# Altium schematic sheet P1.schdoc
size 297 x 209 mm; Symbol: Drawing-Symbol_A4; Device: Drawing-Symbol_A4; Company: 嘉立创EDA; Version: V1.0; Page Size: A4; @Project Name: IC卡门禁-课设; @Update Date: 2026-09-24; @Create Date: 2026-09-24; @Board Name: Board1; @Page Name: P1; @Create Time: 17:26:28; @Page Count: 1; @Page No: 1; @Schematic Name: Schematic1; @Update Time: 17:26:28; @Assembly Variant: Basic; Border: 1; Title Block Position: 3; Size: A4; Width: 1170; Height: 825; Region Start: 1; X Region Count: 6; Y Region Count: 4; Blade Width: 10
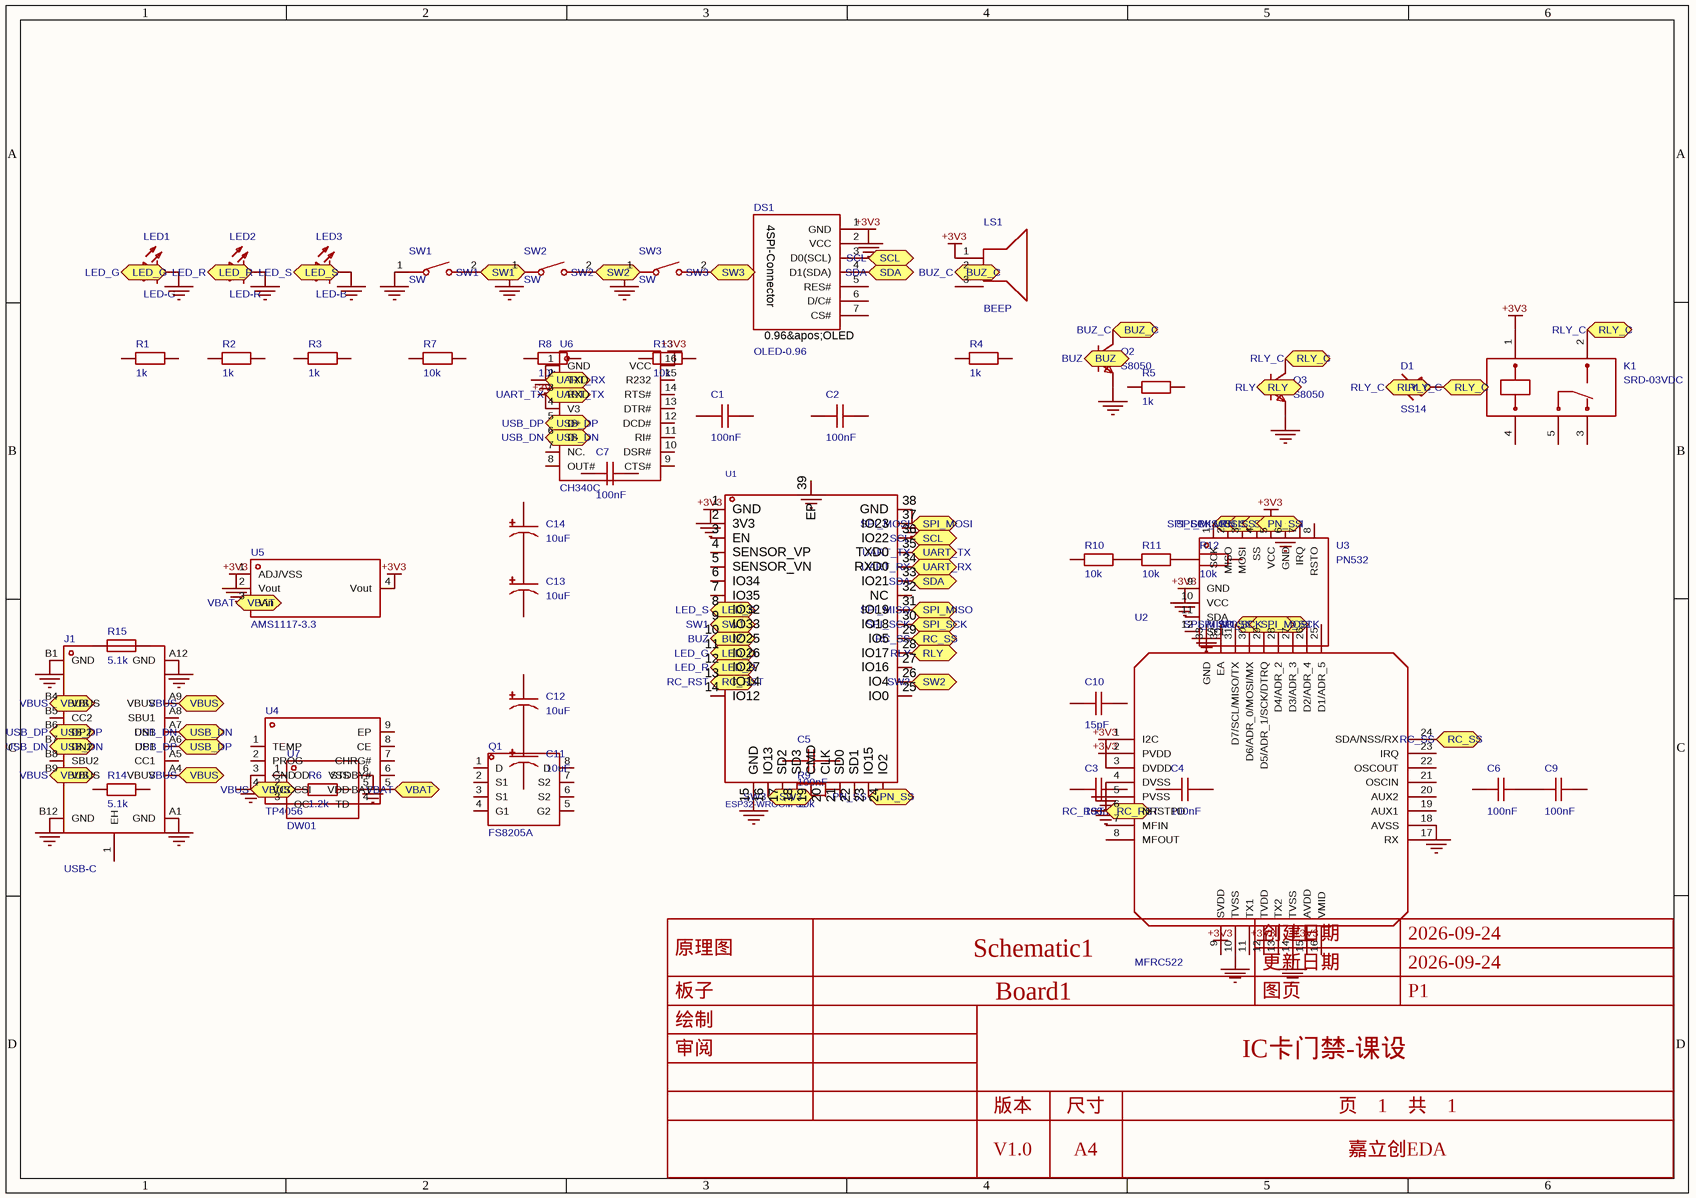
[diagram p0: P1.schdoc]

## Parts
C1  100nF  [C0603]
C2  100nF  [C0603]
C3  100nF  [C0603]
C4  100nF  [C0603]
C5  100nF  [C0603]
C6  100nF  [C0603]
C7  100nF  [C0603]
C9  100nF  [C0603]
C10  15pF  [C0603]
C11  10uF  [CAP-SMD_BD4.0-L4.3-W4.3-LS5.3-FD]
C12  10uF  [CAP-SMD_BD4.0-L4.3-W4.3-LS5.3-FD]
C13  10uF  [CAP-SMD_BD4.0-L4.3-W4.3-LS5.3-FD]
C14  10uF  [CAP-SMD_BD4.0-L4.3-W4.3-LS5.3-FD]
D1  SS14  [SOD-323_L1.7-W1.3-LS2.6-RD-1]
DS1  OLED-0.96  [OLED-TH_JX040101-1]
J1  USB-C  [TYPE-C-SMD_16P-UCB11L69P16]
K1  SRD-03VDC  [RELAY-TH_SRD-XXVDC-XL-C]
LED1  LED-G  [LED-TH_BD4.0-P2.54-FD_RED]
LED2  LED-R  [LED-TH_BD4.0-P2.54-FD_RED]
LED3  LED-B  [LED-TH_BD4.0-P2.54-FD_RED]
LS1  BEEP  [BUZ-SMD_3P-L5.2-W5.2-P3.50-BR]
Q1  FS8205A  [TSSOP-8_L4.4-W3.0-P0.65-LS6.4-BL-2]
Q2  S8050  [SOT-23-3_L2.9-W1.3-P1.90-LS2.4-BR]
Q3  S8050  [SOT-23-3_L2.9-W1.3-P1.90-LS2.4-BR]
R1  1k  [R0603]
R2  1k  [R0603]
R3  1k  [R0603]
R4  1k  [R0603]
R5  1k  [R0603]
R6  1.2k  [R0603]
R7  10k  [R0603]
R8  10k  [R0603]
R9  10k  [R0603]
R10  10k  [R0603]
R11  10k  [R0603]
R12  10k  [R0603]
R13  10k  [R0603]
R14  5.1k  [R0603]
R15  5.1k  [R0603]
SW1  SW  [SW-SMD_L4.0-W2.9-LS5.0]
SW2  SW  [SW-SMD_L4.0-W2.9-LS5.0]
SW3  SW  [SW-SMD_L4.0-W2.9-LS5.0]
U1  ESP32-WROOM-32  [WIFIM-SMD_ESP-WROOM-32]
U2  MFRC522  [QFN-32_L5.0-W5.0-P0.50-BL-EP3.4]
U3  PN532  [COMM-TH_L42.7-W40.4_PN532_NFC_RFID]
U4  TP4056  [SOP-8_L4.9-W3.9-P1.27-LS6.0-TL-EP]
U5  AMS1117-3.3  [SOT-223-3_L6.5-W3.4-P2.30-LS7.0-BR]
U6  CH340C  [SOP-16_L10.0-W3.9-P1.27-LS6.0-BL]
U7  DW01  [SOT-23-6_L2.9-W1.6-P0.95-LS2.8-BL]

## Ports
BUZ (bidir), BUZ_C (bidir), LED_G (bidir), LED_R (bidir), LED_S (bidir), PN_SS (bidir), RC_RST (bidir), RC_SS (bidir), RLY (bidir), RLY_C (bidir), SCL (bidir), SDA (bidir), SPI_MISO (bidir), SPI_MOSI (bidir), SPI_SCK (bidir), SW1 (bidir), SW2 (bidir), SW3 (bidir), UART_RX (bidir), UART_TX (bidir), USB_DN (bidir), USB_DP (bidir), VBAT (bidir), VBUS (bidir)

## Nets
+3V3: DS1.2(VCC) K1.1 LS1.1(+) U1.2(3V3) U2.2(PVDD) U2.3(DVDD) U2.9(SVDD) U2.12(TVDD) U2.15(AVDD) U3.5(VCC) U3.10(VCC) U5.2(Vout) U5.4(Vout) U6.4(V3) U6.16(VCC)
GND: DS1.1(GND) J1.A1(GND) J1.A12(GND) J1.B1(GND) J1.B12(GND) LED1.2(-) LED2.2(-) LED3.2(-) Q2.2(E) Q3.2(E) SW1.1 SW2.1 SW3.1 U1.1(GND) U1.15(GND) U1.38(GND) U1.39(EP) U2.4(DVSS) U2.5(PVSS) U2.10(TVSS) U2.14(TVSS) U2.18(AVSS) U2.33(GND) U3.6(GND) U3.9(GND) U4.3(GND) U5.1(ADJ/VSS) U6.1(GND) U7.6(VSS)
BUZ: Q2.1(B) U1.10(IO25) ; port BUZ
BUZ_C: LS1.2(-) Q2.3(C) ; port BUZ_C
LED_G: LED1.1(+) U1.11(IO26) ; port LED_G
LED_R: LED2.1(+) U1.12(IO27) ; port LED_R
LED_S: LED3.1(+) U1.8(IO32) ; port LED_S
PN_SS: U1.23(IO15) U3.4(SS) ; port PN_SS
RC_RST: U1.13(IO14) U2.6(NRSTPD) ; port RC_RST
RC_SS: U1.29(IO5) U2.24(SDA/NSS/RX) ; port RC_SS
RLY: Q3.1(B) U1.28(IO17) ; port RLY
RLY_C: D1.1 D1.2 K1.2 Q3.3(C) ; port RLY_C
SCL: DS1.3(D0(SCL)) U1.36(IO22) ; port SCL
SDA: DS1.4(D1(SDA)) U1.33(IO21) ; port SDA
SPI_MISO: U1.31(IO19) U2.31(D7/SCL/MISO/TX) U3.2(MISO) ; port SPI_MISO
SPI_MOSI: U1.37(IO23) U2.30(D6/ADR_0/MOSI/MX) U3.3(MOSI) ; port SPI_MOSI
SPI_SCK: U1.30(IO18) U2.29(D5/ADR_1/SCK/DTRQ) U3.1(SCK) ; port SPI_SCK
SW1: SW1.2 U1.9(IO33) ; port SW1
SW2: SW2.2 U1.26(IO4) ; port SW2
SW3: SW3.2 U1.16(IO13) ; port SW3
UART_RX: U1.34(RXD0) U6.2(TXD) ; port UART_RX
UART_TX: U1.35(TXD0) U6.3(RXD) ; port UART_TX
USB_DN: J1.A7(DN1) J1.B7(DN2) U6.6(D-) ; port USB_DN
USB_DP: J1.A6(DP1) J1.B6(DP2) U6.5(D+) ; port USB_DP
VBAT: U4.5(BAT) U5.3(Vin) ; port VBAT
VBUS: J1.A4(VBUS) J1.A9(VBUS) J1.B4(VBUS) J1.B9(VBUS) U4.4(VCC) ; port VBUS
NetC6_2: C6.2 C9.1
NetC11_1: C11.1 C12.2
NetC13_1: C13.1 C14.2
NetR10_2: R10.2 R11.1
NetR11_2: R11.2 R12.1

Not connected (* = marked no-connect by the designer): C1 1 2; C2 1 2; C3 1 2; C4 1 2; C5 1 2; C6 1; C7 1 2; C9 2; C10 1 2; C11 2; C12 1; C13 2; C14 1; DS1 5(RES#) 6(D/C#) 7(CS#); J1 1(EH) A5(CC1) A8(SBU1) B5(CC2) B8(SBU2); K1 3 4 5; LS1 3(NC); Q1 1(D) 2(S1) 3(S1) 4(G1) 5(G2) 6(S2) 7(S2) 8(D); R1 1 2; R2 1 2; R3 1 2; R4 1 2; R5 1 2; R6 1 2; R7 1 2; R8 1 2; R9 1 2; R10 1; R12 2; R13 1 2; R14 1 2; R15 1 2; U1 3(EN) 4(SENSOR_VP) 5(SENSOR_VN) 6(IO34) 7(IO35) 14(IO12) 17(SD2) 18(SD3) 19(CMD) 20(CLK) 21(SD0) 22(SD1) 24(IO2) 25(IO0) 27(IO16) 32(NC); U2 1(I2C) 7(MFIN) 8(MFOUT) 11(TX1) 13(TX2) 16(VMID) 17(RX) 19(AUX1) 20(AUX2) 21(OSCIN) 22(OSCOUT) 23(IRQ) 25(D1/ADR_5) 26(D2/ADR_4) 27(D3/ADR_3) 28(D4/ADR_2) 32(EA); U3 7(IRQ) 8(RSTO) 11(SDA) 12(SCL); U4 1(TEMP) 2(PROG) 6(STDBY#) 7(CHRG#) 8(CE) 9(EP); U6 7(NC.) 8(OUT#) 9(CTS#) 10(DSR#) 11(RI#) 12(DCD#) 13(DTR#) 14(RTS#) 15(R232); U7 1(OD) 2(CSI) 3(OC) 4(TD) 5(VDD)

## Notes on the sheet
- 创建日期
- 2026-09-24
- 原理图
- 板子
- Schematic1
- Board1
- 更新日期
- 图页
- P1
- 绘制
- 审阅
- IC卡门禁-课设
- 版本
- V1.0
- 尺寸
- A4
- 页    1    共    1
- 嘉立创EDA
- (in symbol JX040102-1) 4SPI-Connector; 0.96&apos;OLED

## Library data of the parts
C1-C7 C9 = ST18B104K500CT: 容值:100nF;精度:±10%;额定电压:50V;温度系数:X7R;; Manufacturer: Walsin(华新科); Add into BOM: yes; PCB Layer: Default; Tolerance: ±10%; Voltage Rating: 50V; Temperature Coefficient: X7R; ModelId: ac125912035d415993ca9572d50418b10819f05c4eef4c71ace90d822a990e87; ModelName: C0603_L1.6-W0.8-H0.8; ModelTransform: 62.992,31.496,0,0,0,0,0,0,0; Symbol: ST18B104K500CT; Device: ST18B104K500CT; Convert to PCB: yes; Manufacturer Part: ST18B104K500CT; Supplier: LCSC; Supplier Part: C2918557; LCSC Part Name: 100nF ±10% 50V; Supplier Footprint: 0603; JLCPCB Part Class: Extended Part; Datasheet: https://item.szlcsc.com/datasheet/ST18B104K500CT/3220409.html; Value: 100nF; FootprintName: C0603
C10 = ST18B104K500CT: 容值:100nF;精度:±10%;额定电压:50V;温度系数:X7R;; Manufacturer: Walsin(华新科); Add into BOM: yes; PCB Layer: Default; Value: 100nF; Tolerance: ±10%; Voltage Rating: 50V; Temperature Coefficient: X7R; ModelId: ac125912035d415993ca9572d50418b10819f05c4eef4c71ace90d822a990e87; ModelName: C0603_L1.6-W0.8-H0.8; ModelTransform: 62.992,31.496,0,0,0,0,0,0,0; Symbol: ST18B104K500CT; Device: ST18B104K500CT; Convert to PCB: yes; Manufacturer Part: ST18B104K500CT; Supplier: LCSC; Supplier Part: C2918557; LCSC Part Name: 100nF ±10% 50V; Supplier Footprint: 0603; JLCPCB Part Class: Extended Part; Datasheet: https://item.szlcsc.com/datasheet/ST18B104K500CT/3220409.html; FootprintName: C0603
C11-C14 = CAP-SMD 4*5 10uF ±10% 16V: Add into BOM: yes; PCB Layer: Default; ModelId: 43379036ddca4979995a67be678af8900819f05c4eef4c71ace90d822a990e87; ModelTransform: 208.661,169.291,0,0,0,0,0,0,0; Symbol: CAP-SMD 4*5 10UF ±10% 16V; Device: CAP-SMD 4*5 10uF ±10% 16V; Convert to PCB: yes; Manufacturer Part: CAP-SMD 4*5 10uF ±10% 16V; Supplier: LCSC; Supplier Part: C9900020910; LCSC Part Name: CAP-SMD 4*5 10uF ±10% 16V; Supplier Footprint: CAP-SMD 4*5 10uF ±10% 16V; JLCPCB Part Class: Extended Part; FootprintName: CAP-SMD_BD4.0-L4.3-W4.3-LS5.3-FD; ModelName: CAP-SMD_BD4.0-L4.3-W4.3-LS5.3-FD
D1 = SS14_C9900013398: Add into BOM: yes; PCB Layer: Default; ModelId: eba151483b2844ffacda3a6d97308fa10819f05c4eef4c71ace90d822a990e87; ModelTransform: 100.394,49.2125,0,0,0,0,0,0,0; Symbol: SS14_C9900013398; Device: SS14_C9900013398; Convert to PCB: yes; Manufacturer Part: SS14; Supplier: LCSC; Supplier Part: C9900013398; LCSC Part Name: SS14; Supplier Footprint: SS14/SOD323; JLCPCB Part Class: Extended Part; FootprintName: SOD-323_L1.7-W1.3-LS2.6-RD-1; ModelName: SOD-323_L1.7-W1.3-LS2.6-RD-1
DS1 = JX040102-1: Manufacturer: 技小新; Add into BOM: yes; PCB Layer: Default; ModelId: 8e61ee9dba7b44a2b1026f33715d9dad0819f05c4eef4c71ace90d822a990e87; ModelTransform: 1181.1,1141.73,0,0,0,0,0,-511.102,0; Symbol: JX040102-1; Device: JX040102-1; Convert to PCB: yes; Manufacturer Part: JX040102-1; Supplier: LCSC; Supplier Part: C284855; LCSC Part Name: OLED显示器模块-0.96寸(4PIN)(白色); Supplier Footprint: SMD,30x29mm; JLCPCB Part Class: Extended Part; Datasheet: https://item.szlcsc.com/datasheet/JX040102-1/270264.html; FootprintName: OLED-TH_JX040101-1; ModelName: OLED-TH_JX040101-1
J1 = UCB11L69P16: Add into BOM: yes; PCB Layer: Default; Symbol: UCB11L69P16; Device: UCB11L69P16; Convert to PCB: yes; Manufacturer Part: UCB11L69P16; Supplier: LCSC; Supplier Part: C9900009190; LCSC Part Name: UCB11L69P16; Supplier Footprint: USBCT8; JLCPCB Part Class: Extended Part; FootprintName: TYPE-C-SMD_16P-UCB11L69P16
K1 = SRD-03VDC-SL-C: 线圈电压:3V;触点形式:一组转换:1C(单刀双掷-转换);触点容量(电阻负载):-;最大切换电压:250V@AC;最大切换电流:15A;; Manufacturer: 松乐; Add into BOM: yes; PCB Layer: Default; Coil Voltage: 3V; Coil Rated Power: 360mW; Switching Current(Max): 15A; Coil Type: 无极性-单线圈; Contact Resistance: 100mΩ; Operate Time: 10ms; ModelId: d0eda9b8bf8746d18ae810ab88dc78e70819f05c4eef4c71ace90d822a990e87; ModelName: RELAY-TH_L19.2-W15.6-H15.8; ModelTransform: 755.904,622.4397,0,0,0,0,34.882,0,-118.11; Symbol: SRD-03VDC-SL-C; Device: SRD-03VDC-SL-C; Convert to PCB: yes; Manufacturer Part: SRD-03VDC-SL-C; Supplier: LCSC; Supplier Part: C24585; LCSC Part Name: 蓝色 单组转换型继电器; Supplier Footprint: 插件,19.2x15.6mm; JLCPCB Part Class: Extended Part; Datasheet: https://item.szlcsc.com/datasheet/SRD-03VDC-SL-C/25325.html; Contact Form: 一组转换:1C(单刀双掷-转换); Number of Pins: 5; Contact Rating: -; Switching Voltage(Max): 250V@AC; Release Time: 10ms; Length: 19.2mm; Width: 15.6mm; Height: 15.8mm; FootprintName: RELAY-TH_SRD-XXVDC-XL-C
LED1-LED3 = LED: Symbol: LED_C9900015665; Add into BOM: yes; PCB Layer: Default; ModelId: 08d245f9ade94e79a608b24242b3e8900819f05c4eef4c71ace90d822a990e87; ModelTransform: 137.561,157.46465,0,0,0,0,-8.858,0,-196.85; Device: LED; Convert to PCB: yes; Manufacturer Part: LED; Supplier: LCSC; Supplier Part: C9900015665; LCSC Part Name: LED; Supplier Footprint: SIP-2P; JLCPCB Part Class: Extended Part; FootprintName: LED-TH_BD4.0-P2.54-FD_RED; ModelName: LED-TH_BD4.0-P2.54-FD_RED
LS1 = BEEP_SMT: Add into BOM: yes; PCB Layer: Default; ModelId: 0044e78390e14de39818311c3b0a88040819f05c4eef4c71ace90d822a990e87; ModelName: BUZ-SMD_3P-L5.2-W5.2-H2.0-P3.50; ModelTransform: 207.31557,204.724,0,180,0,0,0.465,-0.002,0; Symbol: BEEP_SMT; Device: BEEP_SMT; Convert to PCB: yes; Manufacturer Part: BEEP_SMT; Supplier: LCSC; Supplier Part: C9900006792; LCSC Part Name: BEEP_SMT; Supplier Footprint: 无源蜂鸣器; JLCPCB Part Class: Extended Part; FootprintName: BUZ-SMD_3P-L5.2-W5.2-P3.50-BR
Q1 = FS8205A_C14212: 类型:2个N沟道;漏源电压(Vdss):20V;连续漏极电流(Id):6A;功率(Pd):1.5W;导通电阻(RDS(on)@Vgs,Id):38mΩ@2.5V,5.2A;阈值电压(Vgs(th)@Id):1.5V@250uA;; Add into BOM: yes; PCB Layer: Default; Type: 2个N沟道; Drain Source Voltage (Vdss): 20V; Continuous Drain Current (Id): 6A; Power Dissipation (Pd): 1.5W; ModelId: 2d0fd2703afb4f81a9dfc54e2181a6240819f05c4eef4c71ace90d822a990e87; ModelTransform: 118.11,251.968,0,0,0,0,0,0,0; Symbol: 8205A_C14212; Device: FS8205A_C14212; Convert to PCB: yes; Manufacturer Part: FS8205A; Supplier: LCSC; Supplier Part: C14212; LCSC Part Name: 2个N沟道 耐压:20V 电流:6A; Supplier Footprint: TSSOP-8; JLCPCB Part Class: Extended Part; Drain Source On Resistance (RDS(on)@Vgs,Id): 38mΩ@2.5V,5.2A; Gate Threshold Voltage (Vgs(th)@Id): 1.5V@250uA; FootprintName: TSSOP-8_L4.4-W3.0-P0.65-LS6.4-BL-2; ModelName: TSSOP-8_L4.4-W3.0-P0.65-LS6.4-BL-2
Q2 Q3 = S8050: 晶体管类型:NPN;集电极电流(Ic):500mA;集射极击穿电压(Vceo):25V;耗散功率(Pd):300mW;直流电流增益(hFE):400;; Manufacturer: Doeshare(德芯); Symbol: S8050_C2931719; Add into BOM: yes; PCB Layer: Default; type: NPN; Current - Collector(Ic): 500mA; Collector - Emitter Voltage VCEO: 25V; Pd - Power Dissipation: 300mW; DC Current Gain: 400; Transition frequency(fT): 150MHz; Current - Collector Cutoff: 100nA; Vce Saturation(VCE(sat)): 600mV; Emitter-Base Voltage(Vebo): 5V; Number: 1个NPN; ModelId: c62791f0466c4ae2a892c056b845b0ca0819f05c4eef4c71ace90d822a990e87; ModelName: SOT-23-3P_L2.9-W1.3-H1.0-LS2.4-P0.95; ModelTransform: 98.425,114.173,0,180,0,0,0.0005,-0.0005,0; Device: S8050; Convert to PCB: yes; Manufacturer Part: S8050; Supplier: LCSC; Supplier Part: C2931719; LCSC Part Name: NPN 电流:500mA 电压:25V; Supplier Footprint: SOT-23; JLCPCB Part Class: Extended Part; Datasheet: https://item.szlcsc.com/datasheet/S8050/3273402.html; FootprintName: SOT-23-3_L2.9-W1.3-P1.90-LS2.4-BR
R1-R6 = Res_0603: Symbol: 电阻; Add into BOM: yes; PCB Layer: Default; Value: 10K; ModelId: fc143cca1e79419f9cd78b61e9279f080819f05c4eef4c71ace90d822a990e87; ModelTransform: 31.8897,63.7794,0,90,0,0,0,0,0; Device: Res_0603; Convert to PCB: yes; Supplier Footprint: 0603; FootprintName: R0603; ModelName: R0603
R7-R13 = Res_0603: Symbol: 电阻; Add into BOM: yes; PCB Layer: Default; ModelId: fc143cca1e79419f9cd78b61e9279f080819f05c4eef4c71ace90d822a990e87; ModelTransform: 31.8897,63.7794,0,90,0,0,0,0,0; Device: Res_0603; Convert to PCB: yes; Supplier Footprint: 0603; Value: 10K; FootprintName: R0603; ModelName: R0603
R14 R15 = RMC06035.1K1%N: 电阻类型:厚膜电阻;阻值:5.1kΩ;精度:±1%;功率:100mW;工作电压:50V;温度系数:±100ppm/℃;; Manufacturer: Tyohm(幸亚电阻); Add into BOM: yes; PCB Layer: Default; Value: 5.1kΩ; Tolerance: ±1%; Power(Watts): 100mW; Voltage-Supply(Max): 50V; ModelId: fc143cca1e79419f9cd78b61e9279f080819f05c4eef4c71ace90d822a990e87; ModelTransform: 31.8897,63.7794,0,90,0,0,0,0,0; Symbol: RMC06035.1K1%N; Device: RMC06035.1K1%N; Convert to PCB: yes; Manufacturer Part: RMC06035.1K1%N; Supplier: LCSC; Supplier Part: C269716; LCSC Part Name: 厚膜电阻 5.1kΩ ±1% 100mW; Supplier Footprint: 0603; JLCPCB Part Class: Extended Part; Datasheet: https://item.szlcsc.com/datasheet/RMC06035.1K1%2525N/259156.html; Type: 厚膜电阻; Temperature Coefficient: ±100ppm/℃; Operating Temperature: -55℃~+155℃; FootprintName: R0603; ModelName: R0603
SW1-SW3 = 轻触按键3*4*H: Add into BOM: yes; PCB Layer: Default; ModelId: 63599cce708d48afbce1b0db003544770819f05c4eef4c71ace90d822a990e87; ModelName: SW-SMD_L4.0-W2.9-H2-LS5.0; ModelTransform: 196.85,114.173,0,0,0,0,0,0,0; Symbol: 轻触按键3*4*H; Device: 轻触按键3*4*H; Convert to PCB: yes; Manufacturer Part: 轻触按键3*4*H; Supplier: LCSC; Supplier Part: C9900017573; LCSC Part Name: 轻触按键3*4*H; Supplier Footprint: 轻触按键3*4*2.5; JLCPCB Part Class: Extended Part; FootprintName: SW-SMD_L4.0-W2.9-LS5.0
U1 = ESP32-WROOM-32: WiFi+双模蓝牙 双核CPU 网口 顶配MCU 低功耗蓝牙 ESP32系列ESP-WROOM-32模组/ESP-32S 4MB; Add into BOM: yes; PCB Layer: Default; ModelId: 5a2678a0bdc04ba384e1e7621568aeee0819f05c4eef4c71ace90d822a990e87; ModelName: WIFIM-SMD_L25.5-W18.0-H3.1; ModelTransform: 709.4474,1004.3287,0,0,0,0,0,145.633,0; Symbol: ESP-WROOM-32; Device: ESP32-WROOM-32; Convert to PCB: yes; Manufacturer Part: ESP32-WROOM-32; Supplier: LCSC; Supplier Part: C95209; LCSC Part Name: 不带固件; Supplier Footprint: -; JLCPCB Part Class: Extended Part; Datasheet: https://item.szlcsc.com/datasheet/ESP32-WROOM-32/96410.html; Features: 集成蓝牙功能；WIFI直连；在线OTA; FootprintName: WIFIM-SMD_ESP-WROOM-32
U2 = MFRC52202HN1,151: 协议:ISO 14443A,MIFARE;接口类型:I2C,SPI,UART;传输速率:106Kbit/s；848Kbit/s；424Kbit/s；212Kbit/s;; Manufacturer: NXP(恩智浦); Add into BOM: yes; PCB Layer: Default; Value: 13.56MHz; Voltage - Supply: 2.5V~3.3V; ModelId: 9cd7b3b2e5534eca85488abae33e32e30819f05c4eef4c71ace90d822a990e87; ModelName: QFN-32_L5.0-W5.0-H0.9-P0.50; ModelTransform: 197.6374,197.6374,0,90,0,0,-0.789,-0.395,0; Symbol: MFRC52202HN1,151; Device: MFRC52202HN1,151; Convert to PCB: yes; Manufacturer Part: MFRC52202HN1,151; Supplier: LCSC; Supplier Part: C11322; LCSC Part Name: 高度集成读写IC 用于13.56MHz非接触通信; Supplier Footprint: QFN-32-EP(5x5); JLCPCB Part Class: Extended Part; Datasheet: https://www.nxp.com/docs/en/data-sheet/MFRC522.pdf?pspll=1; agreement: ISO 14443A,MIFARE; Interface: I2C,SPI,UART; transmission rate: 106Kbit/s；848Kbit/s；424Kbit/s；212Kbit/s; Features: 内置天线驱动；数据校验; FootprintName: QFN-32_L5.0-W5.0-P0.50-BL-EP3.4
U3 = PN532 NFC RFID Module v4: Add into BOM: yes; PCB Layer: Default; Symbol: PN532 NFC RFID MODULE V4; Device: PN532 NFC RFID Module v4; Convert to PCB: yes; Manufacturer Part: PN532 NFC RFID Module v4; Supplier: LCSC; Supplier Part: C9900233104; LCSC Part Name: PN532 NFC RFID Module v4; Supplier Footprint: 插件; FootprintName: COMM-TH_L42.7-W40.4_PN532_NFC_RFID
U4 = TP4056X-42-ESOP8: 工作电压:4V~8V;最大充电电流:1A;电池类型:锂电池;电池节数:1;; Manufacturer: TOPPOWER(南京拓微); Symbol: TP4056X_C2763448; Add into BOM: yes; PCB Layer: Default; The Chip Type: 充电芯片; Voltage - Supply: 4V~8V; Charge Current - Max: 1A; Charging Saturation Voltage: 4.2V; Type of Battery: 锂电池; Number of Cells: 1; Battery Temperature Detection: 支持; 0V Battery Charge: 不支持; Supply Current (Iq): 70uA; ModelId: 4f1f5228684a45afaa7af8cce46001de0819f05c4eef4c71ace90d822a990e87; ModelName: SOP-8_L4.9-W3.9-H1.45-LS6.0-P1.27; ModelTransform: 236.22,189.751,0,0,0,0,-0.051,0.515,0; Device: TP4056X-42-ESOP8; Convert to PCB: yes; Manufacturer Part: TP4056X-42-ESOP8; Supplier: LCSC; Supplier Part: C2763448; LCSC Part Name: 1A线性锂离子电池充电器; Supplier Footprint: SOP-8-EP; JLCPCB Part Class: Extended Part; Datasheet: https://item.szlcsc.com/datasheet/TP4056X-42-ESOP8/2893069.html; End-Off Voltage: -; Operating Temperature: -40℃~+85℃; Balance Current: -; Interface: -; Features: 恒压充电；恒流充电；自动再充电；充电终止；软启动；可编程充电电流；欠压锁定；涓流充电; FootprintName: SOP-8_L4.9-W3.9-P1.27-LS6.0-TL-EP
U5 = AMS1117-3.3V_C5205141: 输出极性:正极;工作电压:15V;输出电压:3.3V;输出电流:1.2A;电源纹波抑制比(PSRR):-;输出类型:固定;; Manufacturer: JSMSEMI(杰盛微); Add into BOM: yes; PCB Layer: Default; Output Configuration: 正极; Voltage - Supply: 15V; Output Voltage: 3.3V; Output Current: 1.2A; Voltage Dropout: 1.5V@(800mA); standby current: 5mA; Output Type: 固定; Number of Outputs: 1; ModelId: 925194bf9823436183a3e0b978a8d0760819f05c4eef4c71ace90d822a990e87; ModelName: SOT-223-4P_L6.5-W3.5-H1.6-LS7.0-P2.30; ModelTransform: 279.89794,255.905,0,180,0,0,-3.9385,-0.0005,0; Symbol: AMS1117-3.3V_C5205141; Device: AMS1117-3.3V_C5205141; Convert to PCB: yes; Manufacturer Part: AMS1117-3.3V; Supplier: LCSC; Supplier Part: C5205141; LCSC Part Name: AMS1117-3.3V 0.8A 15V; Supplier Footprint: SOT-223; JLCPCB Part Class: Extended Part; Datasheet: https://item.szlcsc.com/datasheet/AMS1117-3.3V/5896504.html; Power Supply Rejection Ratio (PSRR): -; Noise: -; Features: 热关断; Operating Temperature: -20℃~+85℃; FootprintName: SOT-223-3_L6.5-W3.4-P2.30-LS7.0-BR
U6 = CH340C: 应用功能:收发器;USB协议版本:USB 2.0;通道数:-;数据速率:2Mbps;; Manufacturer: WCH(南京沁恒); Add into BOM: yes; PCB Layer: Default; Applications Function: 收发器; USB Protocol: USB 2.0; Voltage - Supply: 3.3V；5V; Data Rate: 2Mbps; Current - Supply: 7mA; Quiescent Supply Current: 50uA; ModelId: 3361a6792abf4a8f8fbca4f1924a67ee0819f05c4eef4c71ace90d822a990e87; ModelName: SOP-16_L9.9-W3.9-H1.5-LS6.0-P1.27; ModelTransform: 240.39054,393.7,0,90,0,0,0,0,0; Symbol: CH340C; Device: CH340C; Convert to PCB: yes; Manufacturer Part: CH340C; Supplier: LCSC; Supplier Part: C84681; LCSC Part Name: USB转串口芯片; Supplier Footprint: SOP-16; JLCPCB Part Class: Extended Part; Datasheet: https://item.szlcsc.com/datasheet/CH340C/85852.html; Number of Channels: -; Operating Temperature: -20℃~+70℃; Features: 可编程波特率；内置时钟发生器；上电复位; FootprintName: SOP-16_L10.0-W3.9-P1.27-LS6.0-BL
U7 = DW01: 工作电压:1.5V~10V;最大充电电流:-;电池类型:锂电池;电池节数:1;; Manufacturer: Slkor(萨科微); Symbol: DW01_C359989; Add into BOM: yes; PCB Layer: Default; The Chip Type: 保护芯片; Charging Saturation Voltage: 4.28V; End-Off Voltage: 2.4V; Type of Battery: 锂电池; Number of Cells: 1; Battery Temperature Detection: 不支持; 0V Battery Charge: 支持; Supply Current (Iq): 4uA; ModelId: 18da8f6c14a34920b3e136b5c401a1190819f05c4eef4c71ace90d822a990e87; ModelName: SOT-23-6_L2.9-W1.6-H1.5-LS2.8-P0.95; ModelTransform: 110.236,113.364,0,90,0,0,0.0005,0.0005,0; Device: DW01; Convert to PCB: yes; Manufacturer Part: DW01; Supplier: LCSC; Supplier Part: C359989; LCSC Part Name: 锂电池保护电路; Supplier Footprint: SOT-23-6; JLCPCB Part Class: Extended Part; Datasheet: https://item.szlcsc.com/datasheet/DW01/334808.html; Voltage - Supply: 1.5V~10V; Charge Current - Max: -; Operating Temperature: -40℃~+85℃; Balance Current: -; Interface: -; Features: 过流保护；过充保护；过放保护；短路保护; FootprintName: SOT-23-6_L2.9-W1.6-P0.95-LS2.8-BL